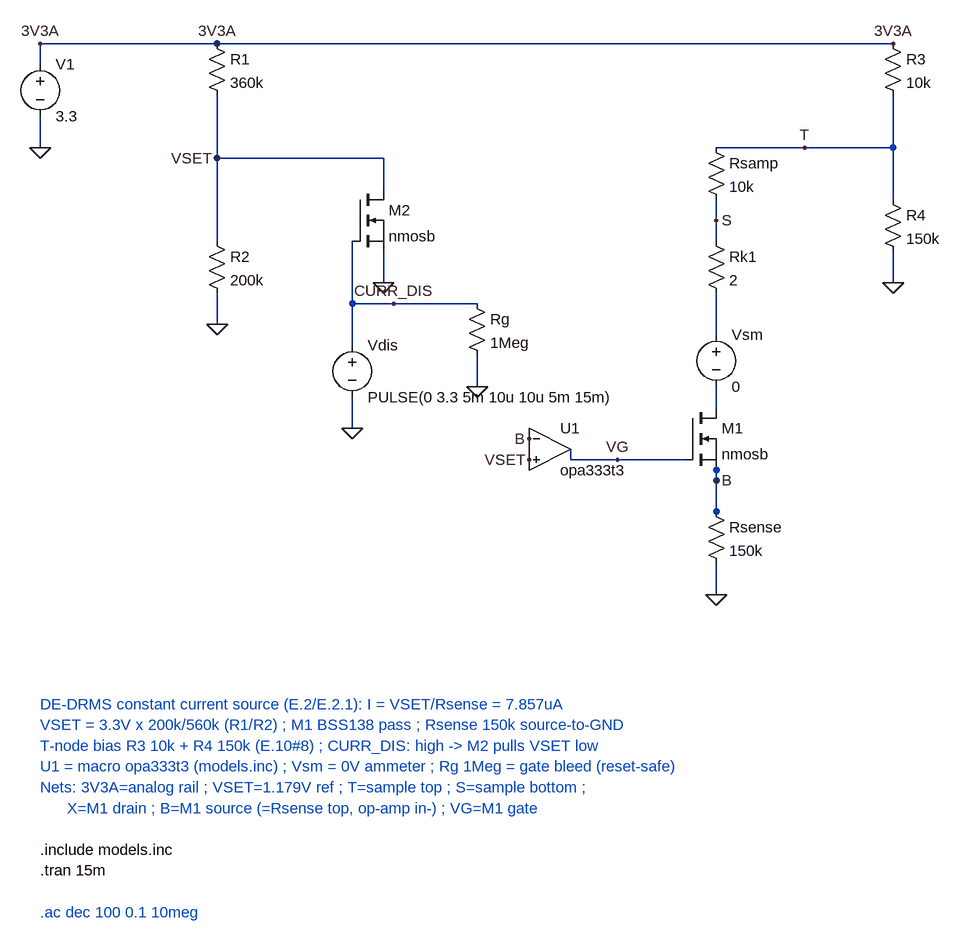
[diagram p0: schematic ccsource.asc]
ccsource.asc, the LTspice schematic file:
Version 4.1
SHEET 1 1936 1080
WIRE 112 64 384 64
WIRE 384 64 1424 64
WIRE 112 64 112 96
WIRE 112 176 112 224
WIRE 384 144 384 240
WIRE 384 240 384 368
WIRE 384 448 384 496
WIRE 384 240 640 240
WIRE 640 240 640 288
WIRE 592 368 592 464
WIRE 592 464 784 464
WIRE 592 464 592 528
WIRE 592 608 592 656
WIRE 640 384 640 432
WIRE 784 544 784 592
WIRE 1424 144 1424 224
WIRE 1424 224 1424 304
WIRE 1424 384 1424 432
WIRE 1152 224 1424 224
WIRE 1152 304 1152 368
WIRE 1152 448 1152 512
WIRE 1152 592 1152 624
WIRE 1152 720 1152 784
WIRE 1152 864 1152 912
WIRE 1152 720 1152 736
WIRE 1152 736 1152 784
WIRE 928 688 928 704
WIRE 928 704 1104 704
FLAG 112 64 3V3A
FLAG 384 64 3V3A
FLAG 1424 64 3V3A
FLAG 112 224 0
FLAG 384 240 VSET
FLAG 384 496 0
FLAG 656 464 CURR_DIS
FLAG 592 656 0
FLAG 640 432 0
FLAG 784 592 0
FLAG 1424 432 0
FLAG 1288 224 T
FLAG 1152 912 0
FLAG 1152 336 S
FLAG 864 672 B
FLAG 864 704 VSET
FLAG 1152 736 B
FLAG 1000 704 VG
SYMBOL voltage 112 80 R0
SYMATTR InstName V1
SYMATTR Value 3.3
SYMBOL res 368 48 R0
SYMATTR InstName R1
SYMATTR Value 360k
SYMBOL res 368 352 R0
SYMATTR InstName R2
SYMATTR Value 200k
SYMBOL nmos 592 288 R0
SYMATTR InstName M2
SYMATTR Value nmosb
SYMBOL voltage 592 512 R0
SYMATTR InstName Vdis
SYMATTR Value PULSE(0 3.3 5m 10u 10u 5m 15m)
SYMBOL res 768 448 R0
SYMATTR InstName Rg
SYMATTR Value 1Meg
SYMBOL res 1408 48 R0
SYMATTR InstName R3
SYMATTR Value 10k
SYMBOL res 1408 288 R0
SYMATTR InstName R4
SYMATTR Value 150k
SYMBOL res 1136 208 R0
SYMATTR InstName Rsamp
SYMATTR Value 10k
SYMBOL res 1136 352 R0
SYMATTR InstName Rk1
SYMATTR Value 2
SYMBOL voltage 1152 496 R0
SYMATTR InstName Vsm
SYMATTR Value 0
SYMBOL nmos 1104 624 R0
SYMATTR InstName M1
SYMATTR Value nmosb
SYMBOL res 1136 768 R0
SYMATTR InstName Rsense
SYMATTR Value 150k
SYMBOL opamp 896 624 R0
SYMATTR InstName U1
SYMATTR Value opa333t3
TEXT 112 1080 Left 2 ;DE-DRMS constant current source (E.2/E.2.1): I = VSET/Rsense = 7.857uA
TEXT 112 1112 Left 2 ;VSET = 3.3V x 200k/560k (R1/R2) ; M1 BSS138 pass ; Rsense 150k source-to-GND
TEXT 112 1144 Left 2 ;T-node bias R3 10k + R4 150k (E.10#8) ; CURR_DIS: high -> M2 pulls VSET low
TEXT 112 1176 Left 2 ;U1 = macro opa333t3 (models.inc) ; Vsm = 0V ammeter ; Rg 1Meg = gate bleed (reset-safe)
TEXT 112 1208 Left 2 ;Nets: 3V3A=analog rail ; VSET=1.179V ref ; T=sample top ; S=sample bottom ;
TEXT 112 1240 Left 2 ;      X=M1 drain ; B=M1 source (=Rsense top, op-amp in-) ; VG=M1 gate
TEXT 112 1304 Left 2 !.include models.inc
TEXT 112 1336 Left 2 !.tran 15m
TEXT 112 1400 Left 2 ;.ac dec 100 0.1 10meg

The netlist it stands for:
* ccsource.asc
V1 3V3A 0 3.3
R1 3V3A VSET 360k
R2 VSET 0 200k
M2 VSET CURR_DIS 0 0 nmosb
Vdis CURR_DIS 0 PULSE(0 3.3 5m 10u 10u 5m 15m)
Rg CURR_DIS 0 1Meg
R3 3V3A T 10k
R4 T 0 150k
Rsamp T S 10k
Rk1 S N001 2
Vsm N001 N002 0
M1 N002 VG B B nmosb
Rsense B 0 150k
X§U1 B VSET VG opa333t3 Aol=100K GBW=10Meg  ; pins invin noninvin out
.model NMOS NMOS
.model PMOS PMOS
.lib standard.mos
* DE-DRMS constant current source (E.2/E.2.1): I = VSET/Rsense = 7.857uA
* VSET = 3.3V x 200k/560k (R1/R2) ; M1 BSS138 pass ; Rsense 150k source-to-GND
* T-node bias R3 10k + R4 150k (E.10#8) ; CURR_DIS: high -> M2 pulls VSET low
* U1 = macro opa333t3 (models.inc) ; Vsm = 0V ammeter ; Rg 1Meg = gate bleed (reset-safe)
* Nets: 3V3A=analog rail ; VSET=1.179V ref ; T=sample top ; S=sample bottom ;
*       X=M1 drain ; B=M1 source (=Rsense top, op-amp in-) ; VG=M1 gate
.include models.inc
.tran 15m
* .ac dec 100 0.1 10meg
.backanno
.end